# EasyEDA Pro project wifi_module.epro

# Schematic Schematic1
Assembly Variant: Basic; Board Name: Board1; Create Date: 2026-10-23; Page Name: P1; Project Name: WIFI_1.0; Schematic Name: Schematic1; Update Date: 2026-10-23; Company: 嘉立创EDA; Page Size: A4; Version: V1.0
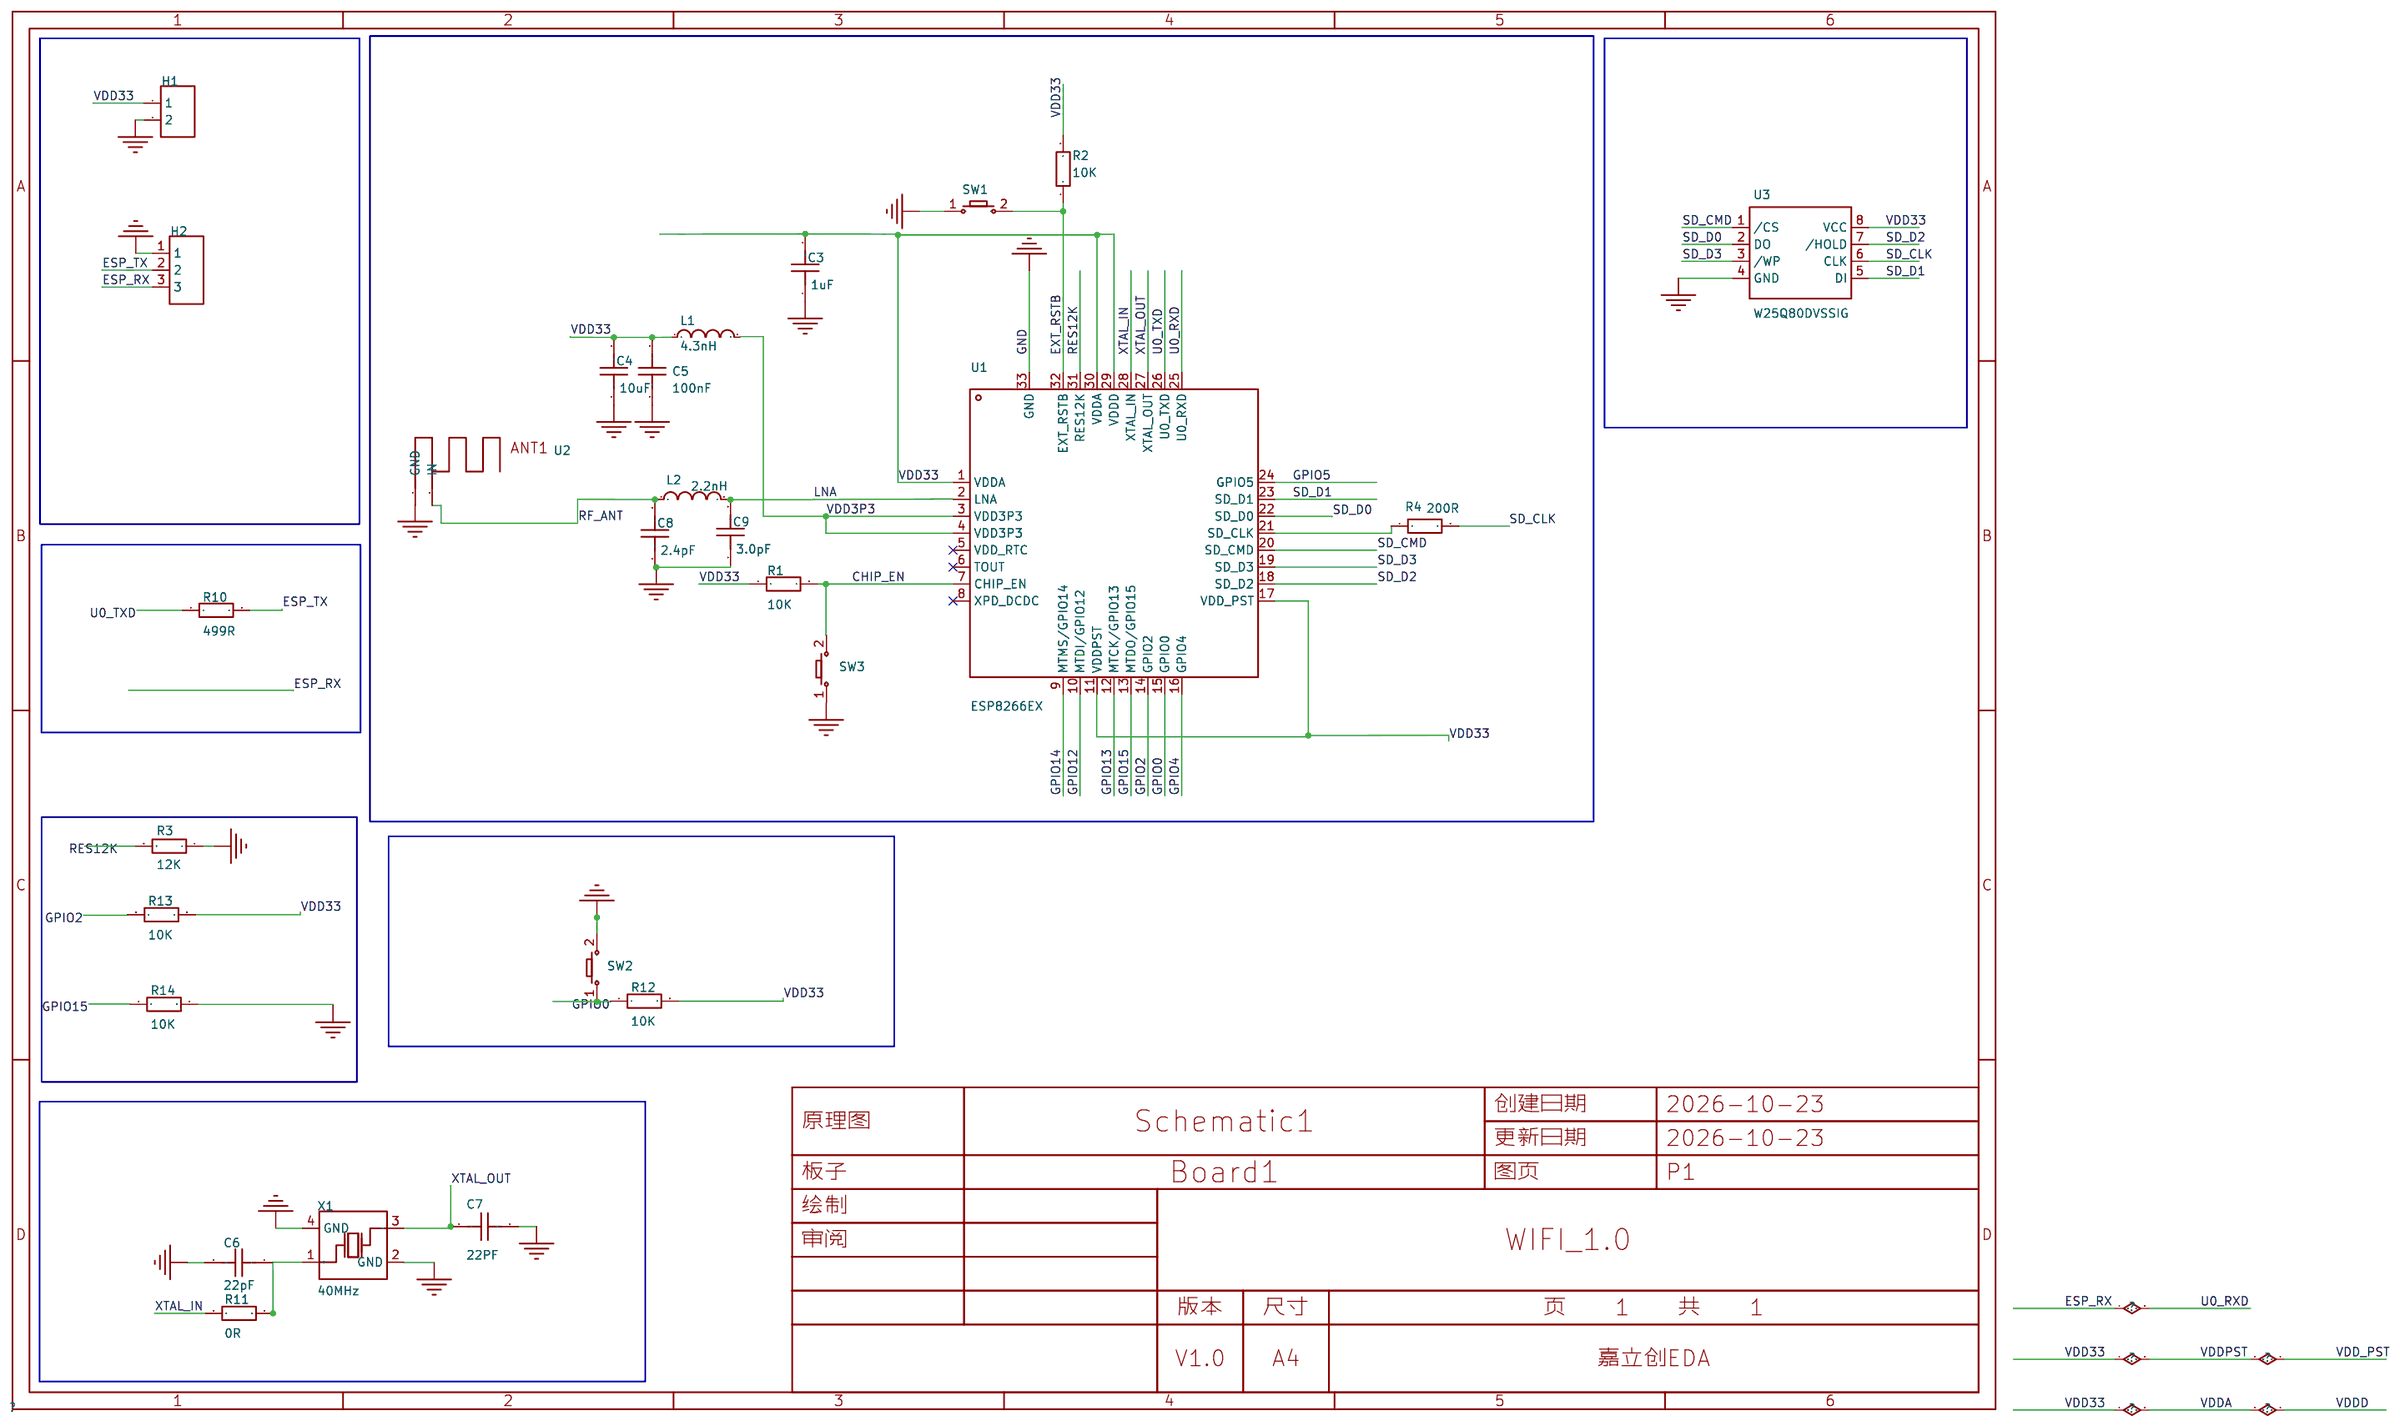
[diagram p0: schematic sheet]

## Parts
C3  1uF  [C0603]
C4  10uF  [C0603]
C5  100nF  [C0603]
C6  22pF  [C0603]
C7  22PF  [C0603]
C8  2.4pF  [C0603]
C9  3.0pF  [C0603]
H1  -  [HDR-TH_2P-P2.54-V-F]
H2  -  [HDR-TH_3P-P2.54-V-F]
L1  4.3nH  [L0603]
L2  2.2nH  [L0603]
R1  10K  [R0603]
R2  10K  [R0603]
R3  12K  [R0603]
R4  200R  [R0603]
R10  499R  [R0603]
R11  0R  [R0603]
R12  10K  [R0603]
R13  10K  [R0603]
R14  10K  [R0603]
SW1  -  [Key_SMD_3x4x2]
SW2  -  [Key_SMD_3x4x2]
SW3  -  [Key_SMD_3x4x2]
U1  ESP8266EX  [QFN-32_L5.0-W5.0-P0.50-BL-EP3.7]
U2  -  [ANT-F-1-2.4G-1.6mmFR4-WCH]
U3  W25Q80DVSSIG  [SOIC-8_L5.3-W5.3-P1.27-LS8.0-BL]
X1  40MHz  [CRYSTAL-SMD_4P-L3.2-W2.5-BL-2]

## Library data of the parts
C3-C9 = CAP_0603: Supplier Footprint: 0603
H1 = HDR-F_2.54_1x2P: Supplier Part: C49661; Supplier Footprint: 插件
H2 = HDR-F_2.54_1x3P: Supplier Part: C541850; Supplier Footprint: 插件
L1 L2 = L_0603
R1-R4 R10-R14 = Res_0603: Supplier Footprint: 0603
SW1-SW3 = Key_SMD_3x4x2: Supplier Footprint: SMD
U1 = ESP8266EX: 频率范围:2.4GHz~2.4835GHz;接口类型:I2C；I2S；UART；SPI;应用领域:WiFi;数据速率:72.2Mbps;灵敏度:-91dBm;典型应用频率:2.4GHz;; LCSC Part Name: 不带固件; Supplier Part: C77967; Manufacturer: ESPRESSIF(乐鑫); Supplier Footprint: QFN-32-EP(5x5); JLCPCB Part Class: Extended Part; Datasheet: https://item.szlcsc.com/datasheet/ESP8266EX/79101.html; Supplier: LCSC; Frequency Range: 2.4GHz~2.4835GHz; Interface: I2C；I2S；UART；SPI; Voltage - Supply: 2.5V~3.6V; Applications: WiFi; Output Power: 21.5dBm; Data Rate: 72.2Mbps; Current Of Transmitting: 120mA; Sensitivity: -91dBm; Receive Current: 50mA; Typical Application Frequency: 2.4GHz; Operating Temperature: -40℃~+125℃; Type: 收发器; Features: CRC校验功能
U2 = 板载天线
U3 = W25Q80DVSSIG: 接口类型:SPI;存储容量:8Mbit;时钟频率(fc):104MHz;; LCSC Part Name: 支持双线和四线SPI接口的串行闪存; Supplier Part: C98163; Manufacturer: Winbond(华邦); Supplier Footprint: SOIC-8-208mil; JLCPCB Part Class: Extended Part; Datasheet: https://item.szlcsc.com/datasheet/W25Q80DVSSIG/99372.html; Supplier: LCSC; Interface: SPI; Memory Size: 8Mbit; Clock Frequency: 104MHz; Voltage - Supply: 2.7V~3.6V; Standby Supply Current: 10uA; Program / Erase Cycles: 100000次; Data Retention - TDR (Year): 20年; Operating Temperature: -40℃~+85℃; Features: 硬件写保护；绝对写保护；写使能锁存；软件写保护
X1 = TXM40M0004322HBCEO00T: 晶振类型:贴片晶振;频率:40MHz;常温频差:±10ppm;负载电容:15pF;频率稳定度:±30ppm;; LCSC Part Name: 40MHz ±10ppm 15pF; Supplier Part: C284179; Manufacturer: YJX(雅晶鑫); Supplier Footprint: SMD3225-4P; JLCPCB Part Class: Extended Part; Datasheet: https://item.szlcsc.com/datasheet/TXM40M0004322HBCEO00T/270228.html; Supplier: LCSC; Type: 贴片晶振; Normal temperature Frequency Tolerance: ±10ppm; Load Capacitance: 15pF; Frequency Stability: ±30ppm; Equivalent Series Resistance(ESR): 30Ω; Operating Temperature: -40℃~+85℃

## Nets
GND: C7.2 C9.1 H1.2 H2.1 R3.1 SW1.1 SW2.2 U1.33(GND)
VDD3P3: L1.2 U1.3(VDD3P3) U1.4(VDD3P3)
VDD33: C3.2 C4.2 C5.2 H1.1 L1.1 R1.1 R2.2 R12.2 R13.2 U1.1(VDDA) U1.11(VDDPST) U1.17(VDD_PST) U1.29(VDDD) U1.30(VDDA) U3.8(VCC)
CHIP_EN: R1.2 SW3.2 U1.7(CHIP_EN)
ESP_RX: H2.3 U1.25(U0_RXD)
ESP_TX: H2.2 R10.2
EXT_RSTB: R2.1 SW1.2 U1.32(EXT_RSTB)
GPIO0: R12.1 SW2.1 U1.15(GPIO0)
GPIO2: R13.1 U1.14(GPIO2)
GPIO4: U1.16(GPIO4)
GPIO5: U1.24(GPIO5)
GPIO12: U1.10(MTDI/GPIO12)
GPIO13: U1.12(MTCK/GPIO13)
GPIO14: U1.9(MTMS/GPIO14)
GPIO15: U1.13(MTDO/GPIO15)
LNA: C9.2
RES12K: R3.2 U1.31(RES12K)
RF_ANT: C8.2 U2.0(IN)
SD_CLK: R4.2 U3.6(CLK)
SD_CMD: U1.20(SD_CMD) U3.1(/CS)
SD_D0: U1.22(SD_D0) U3.2(DO)
SD_D1: U1.23(SD_D1) U3.5(DI)
SD_D2: U1.18(SD_D2) U3.7(/HOLD)
SD_D3: U1.19(SD_D3) U3.3(/WP)
U0_TXD: R10.1 U1.26(U0_TXD)
XTAL_IN: R11.1 U1.28(XTAL_IN)
XTAL_OUT: C7.1 U1.27(XTAL_OUT) X1.3(OSC2)
Net-(R11-2): R11.2 X1.1(OSC1)

Not connected (* = marked no-connect by the designer): C3 1; C4 1; C5 1; C6 1 2; C8 1; L2 1 2; R4 1; R14 1 2; SW3 1; U1 2(LNA) 5(VDD_RTC)* 6(TOUT)* 8(XPD_DCDC)* 21(SD_CLK); U2 1(GND); U3 4(GND); X1 2(GND) 4(GND)

# Board PCB1
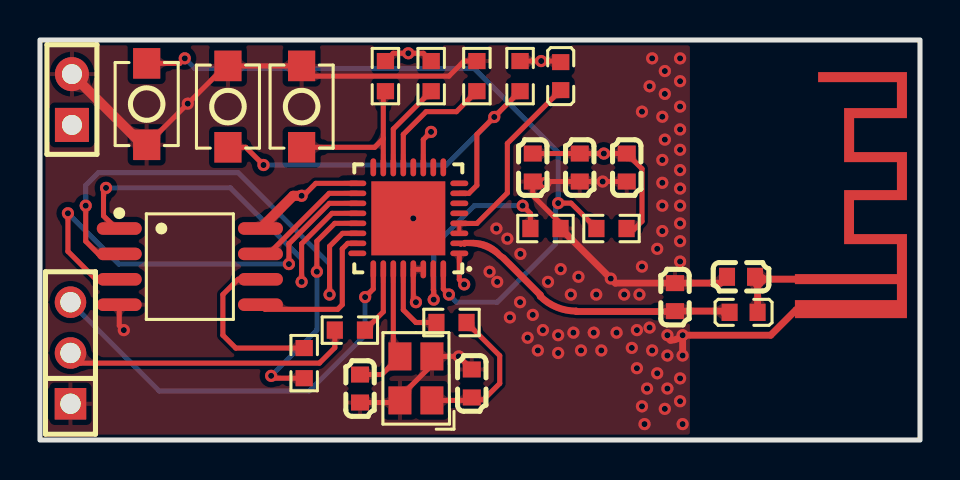
[diagram p1: board, top side]
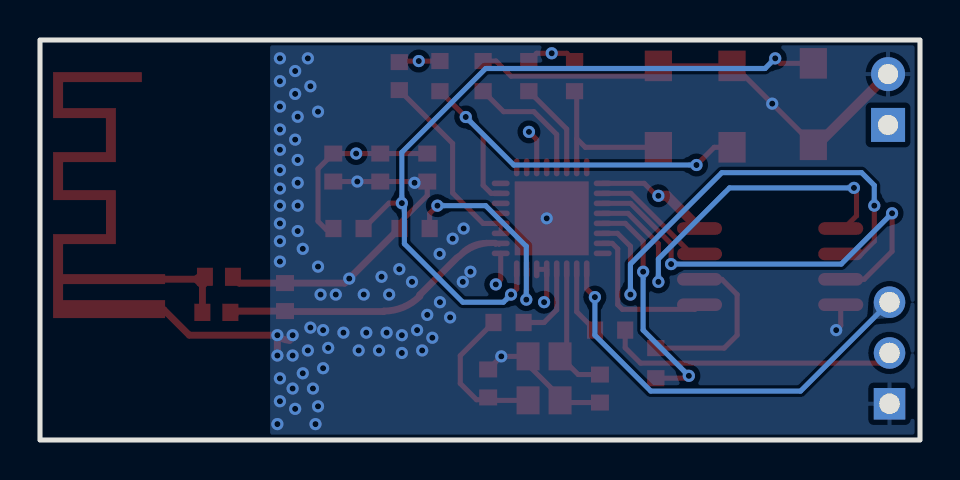
[diagram p2: board, bottom side, seen from below]

Outline 44 x 20 mm; copper layers: Top Layer, Inner1, Inner2, Bottom Layer. Coordinates in mm from the lower left corner of the outline.
Outline path: rectangle 0,20 44,0
Stack: Top Layer 0.035mm Outer layer thickness 1oz / Dielectric1 0.48mm 7628 RC49% 8.6mil / Inner1 0.035mm Inner layer thickness / Dielectric2 0.48mm 1.1mm H/HOZ Copper / Inner2 0.035mm Inner layer thickness / Dielectric3 0.48mm 7628 RC49% 8.6mil / Bottom Layer 0.035mm Outer layer thickness 1oz

## Design rules (mm)
spacing copperThickness1oz (default): track to track 0.102, other pairs 0 to 0.3
spacing copperThickness2oz: track to track 0.203, other pairs 0.152 to 0.3
spacing ANT: track to track 0.152, other pairs 0 to 0.3
track width copperThickness1oz (default): min 0.127, default 0.533, max 2.54
track width copperThickness2oz: min 0.203, default 0.254, max 2.54
differential pair differentialPair (default): width min 0.127, default 0.254, max 2.54; gap min 0.152, default 0.152
net GND uses copperRegion
net VDD33 uses copperRegion
region e441 uses ANT

## Placement (name value [footprint] x y rotation side)
C3  1uF  [C0603]  29.34 13.62 90 top
C4  10uF  [C0603]  26.99 13.62 90 top
C5  100nF  [C0603]  24.64 13.62 90 top
C6  22pF  [C0603]  21.59 2.83 90 top
C7  22PF  [C0603]  16 2.57 270 top
C8  2.4pF  [C0603]  35.05 8.16 0 top
C9  3.0pF  [C0603]  31.75 7.15 270 top
H1  -  [HDR-TH_2P-P2.54-V-F]  1.6 17.02 90 top
H2  -  [HDR-TH_3P-P2.54-V-F]  1.52 4.35 90 top
L1  4.3nH  [L0603]  26.03 18.19 270 top
L2  2.2nH  [L0603]  35.18 6.38 180 top
R1  10K  [R0603]  24 18.19 270 top
R2  10K  [R0603]  28.57 10.57 0 top
R3  12K  [R0603]  25.27 10.57 180 top
R4  200R  [R0603]  13.21 3.84 90 top
R10  499R  [R0603]  15.49 5.49 180 top
R11  0R  [R0603]  20.57 5.88 0 top
R12  10K  [R0603]  17.27 18.19 90 top
R13  10K  [R0603]  19.56 18.19 90 top
R14  10K  [R0603]  21.84 18.19 90 top
SW1  -  [Key_SMD_3x4x2]  5.33 16.8 90 top
SW2  -  [Key_SMD_3x4x2]  13.08 16.67 90 top
SW3  -  [Key_SMD_3x4x2]  9.4 16.67 270 top
U1  ESP8266EX  [QFN-32_L5.0-W5.0-P0.50-BL-EP3.7]  18.41 11.08 90 top
U2  -  [ANT-F-1-2.4G-1.6mmFR4-WCH]  37.85 8.03 270 top
U3  W25Q80DVSSIG  [SOIC-8_L5.3-W5.3-P1.27-LS8.0-BL]  7.49 8.67 270 top
X1  40MHz  [CRYSTAL-SMD_4P-L3.2-W2.5-BL-2]  18.8 3.08 90 top

## Footprints (pads in the part's own frame, mm; a bottom-side part is the same pattern mirrored in y, then rotated)
ANT-F-1-2.4G-1.6mmFR4-WCH
  rect 0.2x0.2 smd: 0(0,0) 1(1.483,0)
  custom 12.3x5.6 smd: 2(-4.21,3.93)
C0603
  rect 0.8x0.9 smd: 1(-0.7,0) 2(0.7,0)
CRYSTAL-SMD_4P-L3.2-W2.5-BL-2
  rect 1.4x1.15 smd: 1(-1.1,-0.8) 2(1.1,-0.8) 3(1.1,0.8) 4(-1.1,0.8)
HDR-TH_2P-P2.54-V-F
  rect 1.7x1.7 hole 1: 1(-1.27,0)
  round 1.7 hole 1: 2(1.27,0)
HDR-TH_3P-P2.54-V-F
  rect 1.575x1.575 hole 1.02: 1(-2.54,0)
  round 1.575 hole 1.02: 2(0,0) 3(2.54,0)
Key_SMD_3x4x2
  rect 1.53x1.36 smd: 1(-2.035,0) 2(2.035,0)
L0603
  rect 0.8x0.864 smd: 1(-0.7,0) 2(0.7,0)
QFN-32_L5.0-W5.0-P0.50-BL-EP3.7
  oval 0.28x0.9 smd: 1(-1.75,-2.55) 2(-1.25,-2.55) 3(-0.75,-2.55) 4(-0.25,-2.55) 5(0.25,-2.55) 6(0.75,-2.55) 7(1.25,-2.55) 8(1.75,-2.55) 17(1.75,2.55) 18(1.25,2.55) 19(0.75,2.55) 20(0.25,2.55) 21(-0.25,2.55) 22(-0.75,2.55) 23(-1.25,2.55) 24(-1.75,2.55)
  oval 0.9x0.28 smd: 9(2.55,-1.75) 10(2.55,-1.25) 11(2.55,-0.75) 12(2.55,-0.25) 13(2.55,0.25) 14(2.55,0.75) 15(2.55,1.25) 16(2.55,1.75) 25(-2.55,1.75) 26(-2.55,1.25) 27(-2.55,0.75) 28(-2.55,0.25) 29(-2.55,-0.25) 30(-2.55,-0.75) 31(-2.55,-1.25) 32(-2.55,-1.75)
  rect 3.7x3.7 smd: 33(0,0)
R0603
  rect 0.806x0.864 smd: 1(-0.753,0) 2(0.753,0)
SOIC-8_L5.3-W5.3-P1.27-LS8.0-BL
  oval 0.63x2.25 smd: 1(-1.905,-3.53) 2(-0.635,-3.53) 3(0.635,-3.53) 4(1.905,-3.53) 5(1.905,3.53) 6(0.635,3.53) 7(-0.635,3.53) 8(-1.905,3.53)

## Nets
GND: C3.1 C4.1 C5.1 C6.2 C7.2 C8.1 C9.1 H1.2 H2.1 R3.1 R14.2 SW1.1 SW2.2 SW3.1 U1.33 U2.1 U3.4 X1.2 X1.4
VDD3P3: L1.2 U1.3 U1.4
VDD33: C3.2 C4.2 C5.2 H1.1 L1.1 R1.1 R2.2 R12.2 R13.2 U1.1 U1.11 U1.17 U1.29 U1.30 U3.8
CHIP_EN: R1.2 SW3.2 U1.7
ESP_RX: H2.3 U1.25
ESP_TX: H2.2 R10.2
EXT_RSTB: R2.1 SW1.2 U1.32
GPIO0: R12.1 SW2.1 U1.15
GPIO2: R13.1 U1.14
GPIO4: U1.16
GPIO5: U1.24
GPIO12: U1.10
GPIO13: U1.12
GPIO14: U1.9
GPIO15: R14.1 U1.13
LNA: C9.2 L2.2 U1.2
RES12K: R3.2 U1.31
RF_ANT: C8.2 L2.1 U2.0
SD_CLK: R4.2 U3.6
SD_CMD: U1.20 U3.1
SD_D0: U1.22 U3.2
SD_D1: U1.23 U3.5
SD_D2: U1.18 U3.7
SD_D3: U1.19 U3.3
U0_TXD: R10.1 U1.26
XTAL_IN: R11.1 U1.28
XTAL_OUT: C7.1 U1.27 X1.3
$1N93: R4.1 U1.21
$1N135: C6.1 R11.2 X1.1

Pads without a net: U1 5 6 8; U2 2

## Via types
v1: diameter 0.61, hole 0.305, Top Layer to Bottom Layer, 97 vias

## Routing (per net, layer and track width the routed paths; a pad name or vN(x,y) marks a point on that pad's centre or on a via; arc(x,y) is an arc through that point)
GND: length 116.1
  Top Layer w0.254: C5.1 24.64,12.23 26.03,10.84 R3.1 ; U3.4 3.96,5.72 v1(4.19,5.49) ; R14.2 21.2,18.95 20.45,18.19 13.59,18.19 13.08,18.71 9.28,18.71 v1(7.39,16.82) SW1.1 ; 25.27,12.92 C4.1 v1(28.13,12.92) C3.1 ; 21.59,3.53 v1(20.94,4.18) 19.6,4.18 19.6,3.75 18,2.15 X1.4 17.89,1.87 C7.2
  Top Layer w0.343: v1(32.13,5.24) v1(32.13,4.22) ; v1(32.13,5.24) arc(31.85,5.05) 31.52,4.99 31.37,5.14 v1(31.37,5.24) ; v1(32.13,5.24) arc(32.18,5.21) 32.24,5.19 32.29,5.24 36.53,5.24 37.8,6.51 38.35,6.51
  Top Layer w0.345: C8.1 34.04,7.84 C9.1 28.76,7.84 v1(28.54,8.07) 26.03,10.57 R3.1
  Top Layer w0.5: SW1.1 5.13,14.76 H1.2
  Inner1 w0.5: v1(4.19,5.49) 7.39,8.69 v1(7.39,16.82) 8.13,17.56 23.5,17.56 v1(28.13,12.92) 28.13,10.64 26.8,9.3 v1(24.02,9.3) 22.48,9.3 20.7,11.08 v1(18.66,11.08) 17.65,10.07 17.65,5.75 19.22,4.18 v1(20.94,4.18)
  vias: v1(22.48,8.42) v1(22.82,10.57) v1(22.86,7.91) v1(23.37,10.07) v1(23.5,6.13) v1(24,6.89) v1(24.38,5.11) v1(24.64,6.26) v1(24.89,4.48) v1(25.15,5.49) v1(25.27,12.86) v1(25.4,7.91) v1(25.91,5.24) v1(25.91,4.35) v1(26.03,8.54) v1(26.54,7.27) v1(26.67,5.37) v1(26.92,8.16) v1(27.05,4.48) v1(27.69,5.37) v1(27.81,7.27) v1(28.07,4.48) v1(28.83,5.37) v1(29.21,7.27) v1(29.59,4.61) v1(29.84,5.49) v1(29.84,3.59) v1(29.97,7.27) v1(30.1,16.42) v1(30.1,8.67) v1(30.1,1.68) v1(30.23,0.8) v1(30.35,2.57) v1(30.48,17.69) v1(30.48,5.62) v1(30.61,19.08) v1(30.61,4.48) v1(30.86,9.56) v1(30.86,3.34) v1(31.11,16.16) v1(31.11,14) v1(31.11,12.86) v1(31.11,11.72) v1(31.11,10.45) v1(31.24,18.45) v1(31.24,17.31) v1(31.24,15.02) v1(31.24,1.56) v1(31.37,4.22) v1(31.37,2.57) v1(32,19.08) v1(32,17.94) v1(32,16.67) v1(32,15.53) v1(32,14.51) v1(32,13.5) v1(32,12.57) v1(32,11.72) v1(32,10.83) v1(32,9.94) v1(32,8.92) v1(32,3.08) v1(32,1.94) v1(32.13,0.8)
VDD3P3: length 9.8
  Top Layer w0.203: U1.4 U1.3
  Top Layer w0.254: U1.4 20.97,10.83 21.84,10.83 23.37,12.35 23.37,14.83 L1.2
VDD33: length 76.1
  Top Layer w0.254: U1.11 19.16,15.02 v1(19.55,15.41) ; R2.2 29.38,10.52 29.69,10.52 30.1,10.93 30.1,13.56 C3.2 v1(28.19,14.32) C4.2 C5.2 ; v1(21.21,7.78) 20.97,8.02 U1.1 ; R1.1 v1(25.06,18.95) 25.98,18.95 L1.1 ; U1.30 U1.29 18.66,7.02 v1(18.8,6.89) ; R13.2 19.17,19.34 v1(18.41,19.34) 17.66,19.34 R12.2 ; U1.17 13.79,12.83 13.12,12.17
  Top Layer w0.5: U3.8 12.66,12.21 v1(13.08,12.21)
  Inner2 w0.5: v1(19.55,15.41) 16.28,15.41 13.33,12.47 ; v1(19.55,15.41) 21.21,13.75 v1(21.21,7.78) ; v1(19.55,15.41) 18.16,16.8 18.16,19.08 v1(18.41,19.34) 24.67,19.34 v1(25.06,18.95) 28.19,15.82 v1(28.19,14.32) ; 13.33,12.47 13.33,12.99 10.57,15.75 H1.1 ; 13.33,12.47 v1(13.08,12.21) ; v1(18.8,6.89) 19.69,6 20.32,6 21.21,6.89 21.21,7.4
CHIP_EN: length 21.3
  Top Layer w0.254: U1.7 21.44,12.33 21.84,12.73 21.84,15.28 v1(22.71,16.15) R1.2 ; v1(11.18,13.75) 10.29,14.64 SW3.2
  Bottom Layer w0.254: v1(22.71,16.15) 20.31,13.75 v1(11.18,13.75)
ESP_RX: length 21.3
  Top Layer w0.254: U1.25 16.66,7.55 16.2,7.09
  Bottom Layer w0.254: H2.3 5.97,2.45 13.46,2.45 16.26,5.24 v1(16.26,7.15)
ESP_TX: length 14.6
  Top Layer w0.254: H2.2 2.03,3.84 13.97,3.84 14.74,4.61 R10.2
EXT_RSTB: length 37.6
  Top Layer w0.254: 7.11,18.96 6.99,18.83 SW1.2 ; v1(20.45,7.27) 20.16,7.55 U1.32 ; R2.1 26.55,11.84 v1(25.91,11.84)
  Bottom Layer w0.254: v1(7.24,19.08) 7.75,18.58 21.72,18.58 25.91,14.38 v1(25.91,11.84) 25.78,11.72 25.78,9.81 22.86,6.89 20.83,6.89 v1(20.45,7.27)
GPIO0: length 8.1
  Top Layer w0.254: 17.16,15.07 U1.15 ; 17.16,15.07 16.73,14.64 SW2.1 ; 17.16,15.07 17.16,17.33 R12.1
GPIO2: length 4.6
  Top Layer w0.254: R13.1 17.66,15.55 U1.14
GPIO15: length 6.2
  Top Layer w0.254: U1.13 18.16,15.28 19.3,16.42 20.82,16.42 R14.1
LNA: length 16.9
  Top Layer w0.203: 21.29,9.8 21.39,9.8 arc(22.27,9.63) 23.01,9.13 ; 21.22,9.91 21.67,9.91 arc(22.35,9.77) 22.93,9.38 ; 21.22,9.76 21.3,9.83 ; U1.2 21.04,9.76 ; 22.8,9.43 arc(23.02,9.29) 23.22,9.11
  Top Layer w0.343: 34.32,6.45 C9.2 31.73,6.42 26.83,6.42 26.81,6.45 arc(25.84,6.64) 25.01,7.19 25.01,7.25 23.16,9.11
  Top Layer w0.533: 34.32,6.32 arc(34.41,6.33) L2.2
RES12K: length 10.8
  Top Layer w0.254: v1(24.13,11.72) 24.52,11.33 R3.2 ; U1.31 19.66,7.51 19.69,7.49 v1(19.69,7.02)
  Bottom Layer w0.254: v1(19.69,7.02) 19.69,9.69 21.72,11.72 v1(24.13,11.72)
RF_ANT: length 4.2
  Top Layer w0.343: 36.06,8.04 36.06,8.04 37.83,8.04 37.84,8.04 ; 35.88,7.85 L2.1
  Top Layer w0.533: 36.06,8.03 35.88,7.85 arc(35.85,8.02) C8.2 arc(35.89,8.07) 36.06,8.03
SD_CLK: length 8.6
  Top Layer w0.254: U3.6 9.91,8.03 9.14,7.27 9.14,5.24 9.79,4.6 R4.2
SD_CMD: length 20.7
  Top Layer w0.254: v1(3.3,12.61) 3.17,12.48 3.17,11.21 3.81,10.57 4.47,10.57 ; v1(13.08,7.91) 13.08,9.81 14.6,11.33 U1.20
  Bottom Layer w0.254: v1(3.3,12.61) 9.52,12.61 13.08,9.05 v1(13.08,7.91)
SD_D0: length 25.2
  Top Layer w0.254: v1(14.48,7.27) 14.48,9.69 15.12,10.33 U1.22 ; 4.47,9.3 2.92,9.3 2.29,9.94 v1(2.29,11.72)
  Bottom Layer w0.254: v1(14.48,7.27) 14.48,8.8 9.91,13.37 2.92,13.37 2.29,12.73 v1(2.29,11.72)
SD_D1: length 7.9
  Top Layer w0.254: U3.5 11.25,6.53 14.88,6.53 15.11,6.76 15.11,9.56 15.39,9.83 U1.23
SD_D2: length 6.1
  Top Layer w0.254: U3.7 11.43,9.3 14.46,12.33 U1.18
SD_D3: length 22.9
  Top Layer w0.254: v1(12.45,8.8) 12.45,9.81 14.47,11.83 U1.19 ; 4.47,8.03 2.79,8.03 1.4,9.43 v1(1.4,11.34)
  Bottom Layer w0.254: v1(1.4,11.34) 3.94,8.8 v1(12.45,8.8)
U0_TXD: length 3.4
  Top Layer w0.254: U1.26 17.16,6.41 R10.1
XTAL_IN: length 3.9
  Top Layer w0.254: U1.28 18.16,6.51 18.8,5.88 R11.1
XTAL_OUT: length 6.9
  Top Layer w0.254: C7.1 17.09,3.27 18,4.18 17.66,4.51 U1.27
$1N93: length 11.8
  Top Layer w0.254: U1.21 14.74,10.83 13.84,9.94 v1(13.84,8.42) ; v1(11.56,3.21) 11.68,3.09 R4.1
  Bottom Layer w0.254: v1(11.56,3.21) 13.84,5.49 v1(13.84,8.42)
$1N135: length 7.6
  Top Layer w0.254: R11.2 22.99,4.22 22.99,2.83 22.17,2.01 21.7,2.01 C6.1 21.44,1.98 X1.1

## Copper pours and planes (outline as drawn; the poured copper is in the pictures)
GND on Top Layer: -6.61,25.25 53.45,25.25 53.45,-7.85 -6.61,-7.85
GND on Bottom Layer: -3.7,25.79 49.67,25.79 49.67,-5.69 -3.7,-5.69
GND on Inner1: -4.45,24.5 49.56,24.5 49.56,-5.69 -4.45,-5.69
VDD33 on Inner2: -5.21,25.68 51.18,25.68 51.18,-6.66 -5.21,-6.66

Small or netless copper shapes (teardrops, artwork), in the pictures only: 138 on Top Layer, 18 on Bottom Layer, 10 on Inner1, 10 on Inner2
